# Altium schematic sheet CAN.SchDoc
size A; SheetNumber: 2; SheetTotal: 4
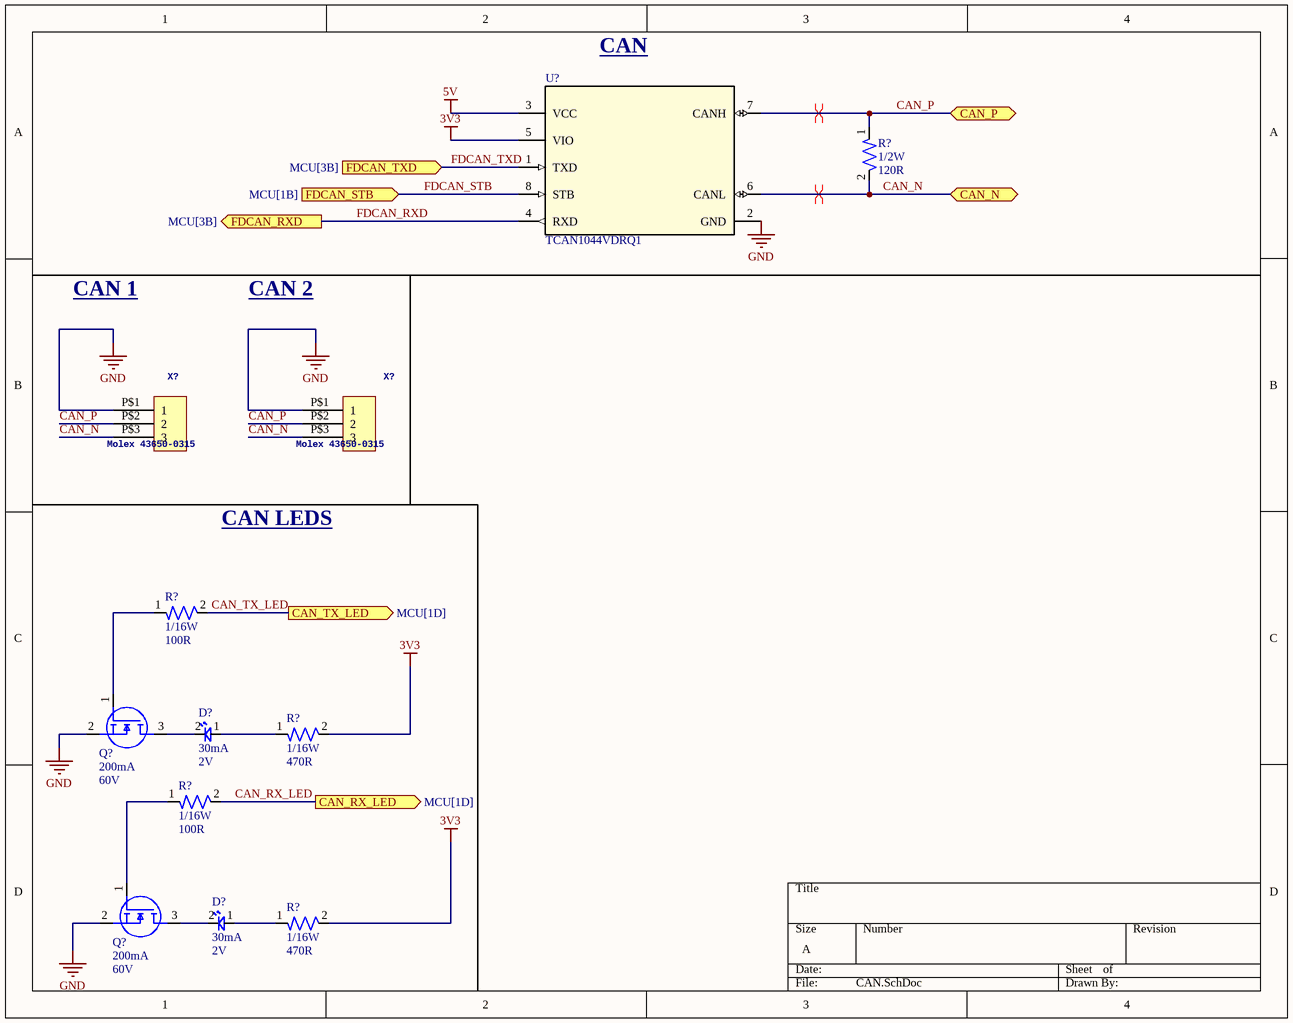
[diagram p0: CAN.SchDoc]

## Parts
(Parts that share a designator on the sheet are numbered #1, #2 ... from top to bottom, then left to right.)
D?#1  Forward Current: 30mA  Forward Voltage: 2V  [LED-0603]  (hidden comment: BL-HKC36G-AV-TRB)
D?#2  Forward Current: 30mA  Forward Voltage: 2V  [LED-0603]  (hidden comment: BL-HKC36G-AV-TRB)
Q?#1  Continuous Current: 200mA  Voltage: 60V  [IC-SOT23-3]  (hidden comment: T2N7002AK,LM)
Q?#2  Continuous Current: 200mA  Voltage: 60V  [IC-SOT23-3]  (hidden comment: T2N7002AK,LM)
R?#1  Power: 1/2W  Resistance: 120R  [RES-1210]  (hidden comment: RC1210FR-07120RL)
R?#2  Power: 1/16W  Resistance: 100R  [RES-0402]  (hidden comment: RC0402FR-07100RL)
R?#3  Power: 1/16W  Resistance: 470R  [RES-0402]  (hidden comment: RC0402FR-07470RL)
R?#4  Power: 1/16W  Resistance: 100R  [RES-0402]  (hidden comment: RC0402FR-07100RL)
R?#5  Power: 1/16W  Resistance: 470R  [RES-0402]  (hidden comment: RC0402FR-07470RL)
U?  TCAN1044VDRQ1  [IC-8SOIC]
X?#1  Molex 43650-0315  [43650-0315]
X?#2  Molex 43650-0315  [43650-0315]

## Ports
CAN_N (bidir), CAN_P (bidir), CAN_RX_LED (out, see MCU[1D]), CAN_TX_LED (out, see MCU[1D]), FDCAN_RXD (out, see MCU[3B]), FDCAN_STB (in, see MCU[1B]), FDCAN_TXD (in, see MCU[3B])

## Nets
3V3: R?#3.2 R?#5.2 U?.5(VIO)
5V: U?.3(VCC)
GND: Q?#1.2(S) Q?#2.2(S) U?.2(GND) X?#1.P$1(1) X?#2.P$1(1)
CAN_N: R?#1.2 U?.6(CANL) X?#1.P$3(3) X?#2.P$3(3) ; port CAN_N
CAN_P: R?#1.1 U?.7(CANH) X?#1.P$2(2) X?#2.P$2(2) ; port CAN_P
CAN_RX_LED: R?#4.2 ; port CAN_RX_LED
CAN_TX_LED: R?#2.2 ; port CAN_TX_LED
FDCAN_RXD: U?.4(RXD) ; port FDCAN_RXD
FDCAN_STB: U?.8(STB) ; port FDCAN_STB
FDCAN_TXD: U?.1(TXD) ; port FDCAN_TXD
NetD?#1_1: D?#1.1 R?#3.1
NetD?#1_2: D?#1.2 Q?#1.3(D)
NetD?#2_1: D?#2.1 R?#5.1
NetD?#2_2: D?#2.2 Q?#2.3(D)
NetQ?#1_1: Q?#1.1(G) R?#2.1
NetQ?#2_1: Q?#2.1(G) R?#4.1

## Layout directives
differential pair: CAN_N, CAN_P

## Notes on the sheet
- CAN
- CAN 1
- CAN 2
- CAN LEDS

## Library data of the parts
D?#1 D?#2 = LED-0001: LED YELLOW CLEAR 0603 SMD; ComponentLink1Description: Datasheet; ComponentLink1URL: https://www.americanbrightled.com/pdffiles/led-components/smt/BL-HKC36G-AV-TRB.pdf
Q?#1 Q?#2 = NMOS-200MA-0001: MOSFET N-CH 60V 200MA SOT23; ComponentLink1Description: Datasheet; ComponentLink1URL: https://toshiba.semicon-storage.com/info/T2N7002AK_datasheet_en_20150401.pdf?did=29712&prodName=T2N7002AK
R?#1 = RES-120-0001: RES 120 OHM 1% 1/2W 1210; Tolerance: 1%; Size: 1210; ComponentLink1Description: Datasheet; ComponentLink1URL: https://www.yageo.com/upload/media/product/products/datasheet/rchip/PYu-RC_Group_51_RoHS_L_12.pdf
R?#2 R?#4 = RES-100-0001: RES 100 OHM 1% 1/16W 0402; Tolerance: 1%; Size: 0402; ComponentLink1Description: Datasheet; ComponentLink1URL: https://www.yageo.com/upload/media/product/products/datasheet/rchip/PYu-RC_Group_51_RoHS_L_12.pdf
R?#3 R?#5 = RES-470-0001: RES 470 OHM 1% 1/16W 0402; Tolerance: 1%; Size: 0402; ComponentLink1Description: Datasheet; ComponentLink1URL: https://www.yageo.com/upload/media/product/products/datasheet/rchip/PYu-RC_Group_51_RoHS_L_12.pdf
U? = IC-CAN-0001: IC TRANSCEIVER 1/1 8SOIC; ComponentLink1Description: Datasheet; ComponentLink1URL: https://www.ti.com/lit/ds/symlink/tcan1044-q1.pdf?HQS=dis-dk-null-digikeymode-dsf-pf-null-wwe&ts=1728758303289&ref_url=https%253A%252F%252Fwww.ti.com%252Fgeneral%252Fdocs%252Fsuppproductinfo.tsp%253FdistId%253D10%2526gotoUrl%253Dhttps%253A%252F%252Fwww.ti.com%252Flit%252Fgpn%252Ftcan1044-q1
X?#1 X?#2 = Micro-Fit Molex 3 Pin Vertical: GateName_1: G$1; SymbolName_1: HEADER_POS3; DeviceSetName: HEADER_POS3_?; DeviceName: 43650-0315; LibraryName: con-molex-micro-fit-3_0_2; Package: 43650-0315